# EasyEDA Pro project fei1554973967-sw3538-dff8db20.epro, board 显示核心板_1
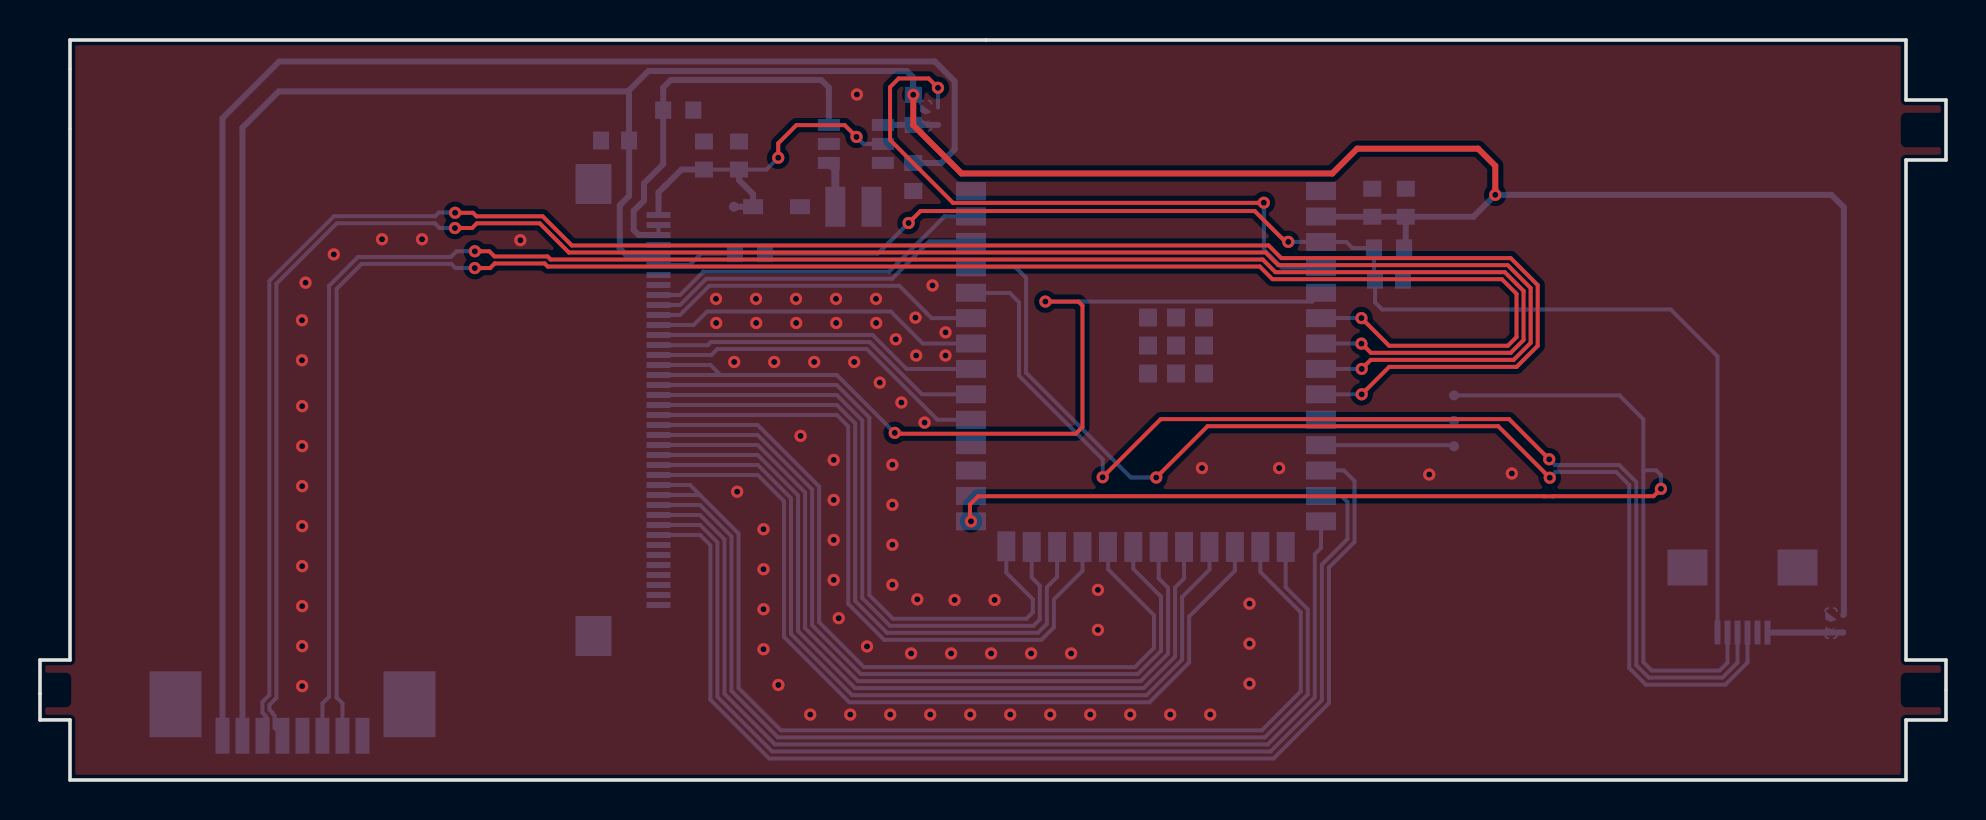
[diagram p5: board, top side]
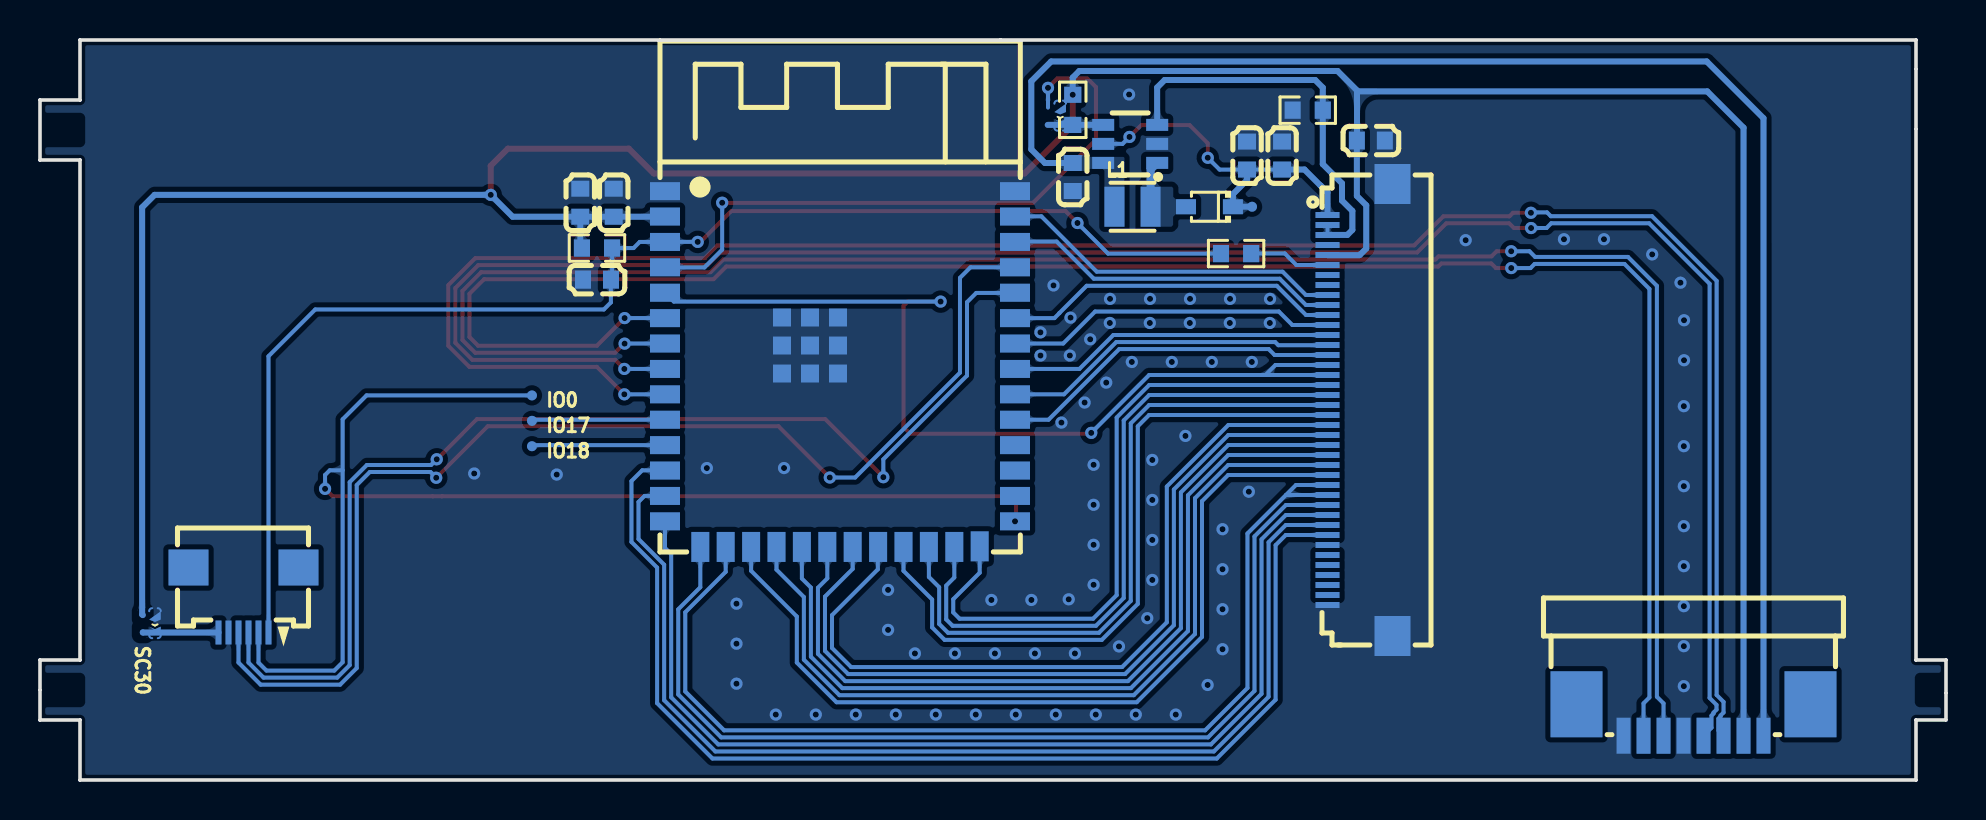
[diagram p6: board, bottom side, seen from below]

Outline 95.3 x 37 mm; copper layers: Top Layer, Bottom Layer. Coordinates in mm from the lower left corner of the outline.
Outline path: 0,6 1.5,6 1.5,37 93.3,37 93.3,34 95.3,34 95.3,31 93.3,31 93.3,6 95.3,6 95.3,3 93.3,3 93.3,0 1.5,0 1.5,3 0,3 0,6
Stack: Top Layer 0.035mm / Dielectric1 1.51mm FR4 er 4.5 / Bottom Layer 0.035mm

## Design rules (mm)
spacing copperThickness1oz (default): track to track 0.152, other pairs 0 to 0.175
spacing copperThickness2oz: track to track 0.203, other pairs 0.152 to 0.3
spacing Plane_innerPlane: track to track 0.152, other pairs 0 to 0.175
spacing Copper_copperRegion: track to track 0.152, other pairs 0 to 0.175
track width copperThickness1oz (default): min 0.127, default 0.254, max 2.54
track width copperThickness2oz: min 0.203, default 0.254, max 2.54
differential pair differentialPair (default): width min 0.127, default 0.254, max 2.54; gap min 0.152, default 0.152
pour e575 uses Copper_copperRegion
pour e586 uses Copper_copperRegion

## Placement (name value [footprint] x y rotation side)
C6  10uF  [C0603]  68.29 28.86 270 bottom
C7  100nF  [C0603]  66.61 28.86 270 bottom
C7#2  -  [C0603]  28.76 31.97 0 bottom
C12  1uF  [C0603]  67.45 25.02 180 bottom
C15  10uF  [C0603]  43.66 30.15 90 bottom
C16  10uF  [C0603]  33.2 31.22 270 bottom
C17  10uF  [C0603]  34.95 31.22 270 bottom
D2  1N5819WS  [SOD-323_L1.8-W1.3-LS2.5-RD]  36.83 28.66 0 bottom
FPC1  0.5-6PQFHY-H1.0 119  [FPC-SMD_6P-P0.50_SHOU-HAN_0.5-6PQFHY-H1.0]  85.12 9 0 bottom
FPC2  FPC-05FB-40PH20  [FPC-SMD_40P-P0.50_XUNPU_FPC-05FB-40PH20]  29.3 18.5 90 bottom
FPC4  AFA07-S08FCA-00  [FPC-SMD_8P-P1.00_LCS-XJ]  12.62 3 180 bottom
IO0  -  [Test-Point-0.5mm]  70.7 19.23 180 bottom
IO17  -  [Test-Point-0.5mm]  70.7 17.96 180 bottom
IO18  -  [Test-Point-0.5mm]  70.7 16.69 180 bottom
L1  10uH  [IND-SMD_L2.0-W2.0]  40.67 28.66 180 bottom
R7  10kΩ  [R0603]  67.45 26.6 0 bottom
R8  0R  [R0603]  35.5 26.32 0 bottom
R9  10Ω  [R0603]  31.91 33.49 0 bottom
R10  10kΩ  [R0603]  43.66 33.51 90 bottom
SC24  -  [短接点0402]  44.9 33.24 90 bottom
SC30  -  [短接点0402]  90.16 7.86 90 bottom
TP1  -  [Test-Point-0.5mm]  34.7 28.66 90 bottom
U1  ESP32-S3-WROOM-1-N16R8  [WIRELM-SMD_ESP32-S3-WROOM-1]  55.3 20.55 180 bottom
U5  SY7200AABC  [SOT-23-6_L2.9-W1.6-P0.95-LS2.8-BR]  40.79 31.81 180 bottom

## Footprints (pads in the part's own frame, mm; a bottom-side part is the same pattern mirrored in y, then rotated)
C0603
  rect 0.8x0.9 smd: 1(-0.7,0) 2(0.7,0)
FPC-SMD_6P-P0.50_SHOU-HAN_0.5-6PQFHY-H1.0
  rect 0.3x1.2 smd: 1(-1.25,1.625) 2(-0.75,1.625) 3(-0.25,1.625) 4(0.25,1.625) 5(0.75,1.625) 6(1.25,1.625)
  rect 2x1.8 smd: 7(2.75,-1.625) 8(-2.75,-1.625)
FPC-SMD_8P-P1.00_LCS-XJ
  rect 0.7x1.8 smd: 1(-3.498,-0.785) 2(-2.498,-0.785) 3(-1.498,-0.785) 4(-0.498,-0.785) 5(0.502,-0.785) 6(1.502,-0.785) 7(2.502,-0.785) 8(3.5,-0.784)
  rect 2.6x3.3 smd: 9(-5.85,0.785) 10(5.85,0.785)
FPC-SMD_40P-P0.50_XUNPU_FPC-05FB-40PH20
  rect 0.3x1.2 smd: 1(9.75,1.625) 2(9.25,1.625) 3(8.75,1.625) 4(8.25,1.625) 5(7.75,1.625) 6(7.25,1.625) 7(6.75,1.625) 8(6.25,1.625) 9(5.75,1.625) 10(5.25,1.625) 11(4.75,1.625) 12(4.25,1.625) 13(3.75,1.625) 14(3.25,1.625) 15(2.75,1.625) 16(2.25,1.625) 17(1.75,1.625) 18(1.25,1.625) 19(0.75,1.625) 20(0.25,1.625) 21(-0.25,1.625) 22(-0.75,1.625) 23(-1.25,1.625) 24(-1.75,1.625) 25(-2.25,1.625) 26(-2.75,1.625) 27(-3.25,1.625) 28(-3.75,1.625) 29(-4.25,1.625) 30(-4.75,1.625) 31(-5.25,1.625) 32(-5.75,1.625) 33(-6.25,1.625) 34(-6.75,1.625) 35(-7.25,1.625) 36(-7.75,1.625) 37(-8.25,1.625) 38(-8.75,1.625) 39(-9.25,1.625) 40(-9.75,1.625)
  rect 2x1.8 smd: 41(-11.3,-1.625) 42(11.3,-1.625)
IND-SMD_L2.0-W2.0
  rect 1x2 smd: 1(-0.905,0) 2(0.905,0)
R0603
  rect 0.806x0.864 smd: 1(-0.753,0) 2(0.753,0)
SOD-323_L1.8-W1.3-LS2.5-RD
  rect 1x0.75 smd: 1(-1.173,0) 2(1.173,0)
SOT-23-6_L2.9-W1.6-P0.95-LS2.8-BR
  rect 1.1x0.6 smd: 1(1.35,-0.95) 2(1.35,0) 3(1.35,0.95) 4(-1.35,0.95) 5(-1.35,0) 6(-1.35,-0.95)
Test-Point-0.5mm
  round 0.5 smd: 1(0,0)
WIRELM-SMD_ESP32-S3-WROOM-1
  rect 1.5x0.9 smd: 1(-8.75,8.895) 2(-8.75,7.625) 3(-8.75,6.355) 4(-8.75,5.085) 5(-8.75,3.815) 6(-8.75,2.545) 7(-8.75,1.275) 8(-8.75,0.005) 9(-8.75,-1.265) 10(-8.75,-2.535) 11(-8.75,-3.805) 12(-8.75,-5.075) 13(-8.75,-6.345) 14(-8.75,-7.615) 27(8.75,-7.615) 28(8.75,-6.345) 29(8.75,-5.075) 30(8.75,-3.805) 31(8.75,-2.535) 32(8.75,-1.265) 33(8.75,0.005) 34(8.75,1.275) 35(8.75,2.545) 36(8.75,3.815) 37(8.75,5.085) 38(8.75,6.355) 39(8.75,7.625) 40(8.75,8.895)
  rect 0.9x1.5 smd: 15(-6.985,-8.895) 16(-5.715,-8.895) 17(-4.445,-8.895) 18(-3.175,-8.895) 19(-1.905,-8.895) 20(-0.635,-8.895) 21(0.635,-8.895) 22(1.905,-8.895) 23(3.175,-8.895) 24(4.445,-8.895) 25(5.715,-8.895) 26(6.985,-8.865)
  rect 0.9x0.9 smd: 41(-2.9,-0.225) 41(-2.9,1.175) 41(-2.9,2.575) 41(-1.5,-0.225) 41(-1.5,1.175) 41(-1.5,2.575) 41(-0.1,-0.225) 41(-0.1,1.175) 41(-0.1,2.575)
短接点0402
  custom 0.579x0.58 smd: 1(-0.479,-0.61)
  custom 0.69x0.58 smd: 2(0.385,-0.61)

## Nets
As in the schematic, except:
3.3V: C6.2 C7.2 C7#2.2 FPC2.5 FPC4.7 R7.2 R10.2 SC30.2 U1.2
GND: C6.1 C7.1 C7#2.1 C12.1 C15.1 C16.1 C17.1 FPC1.5 FPC2.4 FPC2.34 FPC2.40 FPC2.41 FPC2.42 FPC4.1 FPC4.4 R9.2 U1.1 U1.40 U1.41 U5.2
GPIO0: FPC1.2 IO0.1 U1.27
GPIO17: IO17.1 U1.10
GPIO18: IO18.1 U1.11

Pads without a net: FPC1 7 8; FPC2 7 8 35 36 37 38 39; FPC4 9 10; U1 28 29 30

## Via types
v1: diameter 0.61, hole 0.305, Top Layer to Bottom Layer, 108 vias

## Routing (per net, layer and track width the routed paths; a pad name or vN(x,y) marks a point on that pad's centre or on a via; arc(x,y) is an arc through that point)
3.3V: length 159.1
  Top Layer w0.3: v1(72.76,29.26) 72.76,30.71 71.9,31.57 65.86,31.57 64.62,30.33 46.08,30.33 43.66,32.74 v1(43.66,34.26)
  Bottom Layer w0.3: 29.45,34.43 29.45,34.48 30.42,35.45 43.33,35.45 43.66,35.12 v1(43.66,34.26) ; 29.45,34.43 11.94,34.43 10.12,32.62 FPC4.7 ; 29.45,34.43 29.45,31.98 C7#2.2 29.46,29.2 28.99,28.73 28.99,26.57 29.32,26.25 30.92,26.25 FPC2.5 ; C6.2 68.29,26.68 R7.2 ; C6.2 71.67,28.16 v1(72.76,29.26) 89.57,29.26 90.19,28.63 90.19,8.28 90.16,8.25 ; C6.2 C7.2 64.06,28.16 U1.2
+5V: length 74.8
  Bottom Layer w0.3: FPC4.8 9.13,33.09 11.96,35.93 44.74,35.93 45.73,34.93 45.73,31.53 45.05,30.85 C15.2
GND:
  vias: v1(13.1,22.99) v1(13.1,20.99) v1(13.11,18.69) v1(13.11,16.69) v1(13.11,14.69) v1(13.11,12.69) v1(13.11,10.69) v1(13.11,8.69) v1(13.11,6.69) v1(13.11,4.69) v1(13.28,24.87) v1(14.69,26.28) v1(17.1,27.04) v1(19.1,27.04) v1(24.02,26.99) v1(33.8,24.06) v1(33.81,22.85) v1(34.71,20.9) v1(34.86,14.42) v1(35.8,24.06) v1(35.81,22.85) v1(36.17,12.54) v1(36.17,10.54) v1(36.17,8.54) v1(36.17,6.54) v1(36.71,20.9) v1(36.92,4.75) v1(37.8,24.06) v1(37.81,22.85) v1(38.03,17.2) v1(38.51,3.27) v1(38.71,20.9) v1(39.68,16) v1(39.68,14) v1(39.68,12) v1(39.68,10) v1(39.8,24.06) v1(39.81,22.85) v1(39.94,8.09) v1(40.51,3.27) v1(40.71,20.9) v1(40.85,34.27) v1(41.35,6.68) v1(41.8,24.06) v1(41.81,22.85) v1(41.99,19.87) v1(42.51,3.27) v1(42.62,15.76) v1(42.62,13.76) v1(42.62,11.76) v1(42.62,9.76) v1(42.79,22.03) v1(43.07,18.87) v1(43.55,6.33) v1(43.77,23.12) v1(43.81,21.22) v1(43.86,9.03) v1(44.23,17.87) v1(44.51,3.27) v1(44.62,24.73) v1(45.28,22.38) v1(45.27,21.22) v1(45.55,6.33) v1(45.73,9) v1(46.51,3.27) v1(47.55,6.33) v1(47.73,9) v1(48.51,3.27) v1(49.55,6.33) v1(50.51,3.27) v1(51.55,6.33) v1(52.51,3.27) v1(52.9,9.51) v1(52.9,7.51) v1(54.51,3.27) v1(56.51,3.27) v1(58.1,15.6) v1(58.51,3.27) v1(60.48,8.82) v1(60.48,6.82) v1(60.48,4.82) v1(61.96,15.6) v1(69.46,15.27) v1(73.59,15.33)
B0: length 47.8
  Top Layer w0.2: v1(50.27,23.92) 51.92,23.92 52.12,23.72 52.12,17.65 51.79,17.31 42.78,17.31 v1(42.74,17.36)
  Bottom Layer w0.2: FPC2.16 33.53,20.75 34.03,20.25 ; v1(50.27,23.92) 63.61,23.92 U1.5 ; v1(42.74,17.36) 39.84,20.25 34.03,20.25 ; 34.03,20.25 FPC2.17
B2: length 32.7
  Bottom Layer w0.2: U1.26 48.31,10.36 49.64,9.04 49.64,8.38 49.32,8.06 42.65,8.06 41.47,9.24 41.47,18.12 39.84,19.75 FPC2.18
B3: length 33
  Bottom Layer w0.2: FPC2.19 39.84,19.25 41.11,17.98 41.11,9.1 42.5,7.71 49.67,7.71 49.99,8.03 49.99,9.72 49.58,10.12 U1.25
B4: length 33.6
  Bottom Layer w0.2: FPC2.20 39.84,18.75 40.76,17.83 40.76,8.95 42.36,7.36 49.9,7.36 50.34,7.8 50.34,9.64 50.86,10.15 U1.24
B5: length 34.5
  Bottom Layer w0.2: U1.23 52.12,10.46 50.69,9.03 50.69,7.63 50.07,7.01 42.21,7.01 40.41,8.81 40.41,17.69 39.85,18.25 FPC2.21
CS: length 16.9
  Bottom Layer w0.2: U1.35 46.55,23.09 44.58,23.09 44.33,23.34 44.33,23.35 42.97,24.71 33.46,24.71 32,23.25 FPC2.11
DE: length 16.3
  Bottom Layer w0.2: FPC2.13 41.63,22.25 43.33,20.55 U1.33
EN: length 66.9
  Top Layer w0.2: v1(62.42,26.91) 62.28,26.91 60.73,28.45 44.03,28.45 v1(43.43,27.85)
  Bottom Layer w0.2: v1(62.42,26.91) 64.05,26.91 U1.3 65.31,26.9 65.62,26.6 66.7,26.6 ; FPC1.1 83.87,21.19 81.54,23.53 67.11,23.53 66.76,23.88 66.76,25.01 C12.2 66.7,25.07 R7.1 ; R8.2 41.9,26.32 v1(43.43,27.85)
FAN: length 104.3
  Top Layer w0.2: v1(20.75,28.36) 21.65,28.36 21.83,28.18 25.13,28.18 26.59,26.73 61.43,26.73 62.06,26.09 73.53,26.09 74.88,24.75 74.88,21.71 73.83,20.66 67.46,20.66 v1(66.08,19.28)
  Bottom Layer w0.2: U1.9 v1(66.08,19.28) ; 11.37,2.47 FPC4.6 ; v1(20.75,28.36) 20.74,28.38 19.95,28.38 19.76,28.19 14.7,28.19 11.47,24.96 11.47,4.25 11.12,3.91 11.12,3.37 11.27,3.22 11.27,3.17 11.37,3.07 11.37,2.47
G0: length 40.2
  Bottom Layer w0.2: U1.22 53.41,11.64 53.41,10.53 55.7,8.24 55.7,6.6 54.75,5.65 41.19,5.65 38.96,7.88 38.96,14.67 35.88,17.75 FPC2.22
G1: length 40.3
  Bottom Layer w0.2: U1.21 54.67,10.55 56.05,9.17 56.05,6.46 54.89,5.3 41.05,5.3 38.61,7.74 38.61,14.53 35.88,17.25 FPC2.23
G2: length 40.4
  Bottom Layer w0.2: FPC2.24 35.89,16.75 38.26,14.38 38.26,7.59 40.9,4.94 55.04,4.94 56.4,6.31 56.4,9.61 55.93,10.08 U1.20
G3: length 41
  Bottom Layer w0.2: U1.19 57.2,10.07 56.76,9.62 56.76,6.16 55.18,4.59 40.76,4.59 37.9,7.45 37.9,14.23 35.89,16.25 FPC2.25
G4: length 41.9
  Bottom Layer w0.2: FPC2.26 35.89,15.75 37.55,14.09 37.55,7.3 40.61,4.24 55.33,4.24 57.11,6.02 57.11,9.15 58.48,10.52 U1.18
G5: length 42.8
  Bottom Layer w0.2: U1.17 59.74,10.46 57.46,8.17 57.46,5.87 55.48,3.89 40.46,3.89 37.2,7.15 37.2,13.94 35.89,15.25 FPC2.27
GPIO0: length 65.6
  Top Layer w0.2: v1(46.55,12.93) 46.5,12.98 46.5,13.77 46.92,14.19 75.2,14.19 75.21,14.19 75.67,14.19 75.67,14.19 80.68,14.19 v1(81.05,14.56)
  Bottom Layer w0.2: 80.17,15.49 80.17,5.89 80.58,5.47 83.98,5.47 84.37,5.87 FPC1.2 ; 80.17,15.49 80.81,15.49 81.05,15.25 v1(81.05,14.56) ; 80.17,15.49 80.17,18.03 78.97,19.23 IO0.1
GPIO1: length 17.3
  Bottom Layer w0.2: FPC2.9 32,24.25 33.17,25.42 42.46,25.42 45.23,28.18 46.54,28.18 U1.39
GPIO2: length 16.9
  Bottom Layer w0.2: U1.38 46.53,26.92 44.47,26.92 42.61,25.06 33.31,25.06 32,23.75 FPC2.10
GPIO3: length 50.5
  Bottom Layer w0.2: FPC2.30 33,13.75 34.58,12.18 34.58,4.45 36.9,2.13 61.24,2.13 63.39,4.28 63.39,8.53 62.29,9.64 U1.15
GPIO4: length 32
  Top Layer w0.2: v1(61.19,28.86) 61.19,28.86 45.65,28.86 42.5,32 42.5,34.65 42.93,35.08 44.43,35.08 v1(44.9,34.61)
  Bottom Layer w0.2: v1(61.19,28.86) 61.19,26.51 62.08,25.63 64.05,25.63 U1.4 ; 44.9,33.62 v1(44.9,34.61)
GPIO6: length 95.5
  Top Layer w0.2: v1(21.74,25.6) 22.5,25.6 22.73,25.83 25.23,25.83 25.38,25.67 60.99,25.67 61.62,25.04 73.1,25.04 73.83,24.31 73.83,22.15 73.39,21.71 67.45,21.71 v1(66.07,23.1)
  Bottom Layer w0.2: v1(66.07,23.1) 64.05,23.1 U1.6 ; v1(21.74,25.6) 20.77,25.6 20.57,25.8 16.08,25.8 14.83,24.55 14.83,4.13 15.12,3.83 FPC4.2
GPIO7: length 96.9
  Top Layer w0.2: v1(21.74,26.44) 22.47,26.44 22.72,26.18 25.37,26.18 25.53,26.02 61.14,26.02 61.77,25.39 73.24,25.39 74.18,24.45 74.18,22 73.54,21.36 66.54,21.36 66.08,21.82
  Bottom Layer w0.2: FPC4.3 14.12,3.83 14.45,4.16 14.45,24.71 15.9,26.15 20.54,26.15 20.83,26.44 v1(21.74,26.44) ; U1.7 66.08,21.82 66.08,21.82
  vias: v1(66.07,21.82)
GPIO8: length 57.4
  Bottom Layer w0.2: FPC2.33 33.01,12.25 33.52,11.74 33.52,4.02 36.46,1.07 61.68,1.07 64.44,3.84 64.44,10.62 65.73,11.9 65.73,14.94 65.19,15.48 64.06,15.48 U1.12
GPIO15: length 102.3
  Top Layer w0.2: v1(20.75,27.6) 21.6,27.6 21.84,27.83 24.99,27.83 26.44,26.38 61.28,26.38 61.91,25.74 73.39,25.74 74.53,24.6 74.53,21.86 73.68,21.01 66.54,21.01 v1(66.08,20.55)
  Bottom Layer w0.2: FPC4.5 11.72,2.61 11.72,3.22 11.62,3.32 11.62,3.37 11.47,3.52 11.47,3.76 11.82,4.1 11.82,24.81 14.84,27.84 19.74,27.84 19.98,27.6 v1(20.75,27.6) ; U1.8 v1(66.08,20.55)
GPIO17: length 6.7
  Bottom Layer w0.2: U1.10 70.65,18.01 IO17.1
GPIO18: length 6.7
  Bottom Layer w0.2: U1.11 70.65,16.74 IO18.1
GPIO19: length 55.3
  Bottom Layer w0.2: U1.13 65.07,14.2 65.37,13.9 65.37,12.05 64.09,10.77 64.09,3.99 61.53,1.43 36.61,1.43 33.87,4.16 33.87,11.89 33.01,12.75 FPC2.32
GPIO20: length 52
  Bottom Layer w0.2: FPC2.31 33.01,13.25 34.22,12.03 34.22,4.31 36.75,1.78 61.38,1.78 63.74,4.13 63.74,11.29 64.05,11.6 ; 64.05,11.6 U1.14
GPIO38: length 17.2
  Bottom Layer w0.2: U1.31 44.87,18.01 41.34,21.55 33.87,21.55 33.57,21.25 FPC2.15
GPIO39: length 16.8
  Bottom Layer w0.2: FPC2.14 30.94,21.74 33.38,21.74 33.54,21.9 41.49,21.9 44.1,19.28 U1.32
GPIO41: length 16.6
  Bottom Layer w0.2: U1.34 46.55,21.83 44.14,21.83 42.54,23.42 33.36,23.42 32.68,22.75 FPC2.12
GPIO46: length 52.7
  Bottom Layer w0.2: 33,14.25 32.5,14.75 FPC2.28 ; 33,14.25 FPC2.29 ; 33,14.25 34.93,12.32 34.93,4.6 37.04,2.48 61.09,2.48 63.04,4.43 63.04,8.39 61.02,10.41 U1.16
LEDA: length 17.7
  Top Layer w0.2: v1(36.91,31.11) 36.91,31.84 37.82,32.75 40.23,32.75 v1(40.83,32.15)
  Bottom Layer w0.2: C16.2 C17.2 36.32,30.52 v1(36.91,31.11) ; v1(40.83,32.15) 41.17,31.81 U5.5
  Bottom Layer w0.3: C16.2 33.19,30.52 32.08,30.52 31.28,29.72 31.27,29.72 30.92,29.38 FPC2.1 ; C17.2 34.95,30 35.65,29.29 D2.1 TP1.1
LEDK: length 20
  Bottom Layer w0.2: FPC2.3 FPC2.2
  Bottom Layer w0.3: FPC2.3 30.92,27.25 29.93,27.25 29.68,27.5 29.68,28.45 30.2,28.97 30.2,29.83 31.16,30.79 R9.1 31.16,34.62 31.54,35 39.07,35 39.44,34.62 39.44,32.76
RESET: length 4.1
  Bottom Layer w0.2: R8.1 34.74,26.33 33.06,26.33 32.48,25.75 FPC2.6
RX: length 58.6
  Top Layer w0.2: v1(53.13,15.14) 56.04,18.04 73.45,18.04 v1(75.46,16.04)
  Bottom Layer w0.2: U1.36 46.56,24.35 48.49,24.35 48.95,23.89 48.95,20.22 53.13,16.03 v1(53.13,15.14) ; v1(75.46,16.04) 75.75,15.75 78.96,15.75 79.82,14.89 79.82,5.74 80.44,5.12 84.12,5.12 84.87,5.87 FPC1.3
TX: length 59.9
  Top Layer w0.2: v1(55.81,15.12) 58.38,17.69 72.91,17.69 v1(75.49,15.11)
  Bottom Layer w0.2: v1(75.49,15.11) 75.78,15.4 78.81,15.4 79.46,14.75 79.46,5.6 80.29,4.77 84.27,4.77 85.37,5.87 FPC1.4 ; U1.37 48.78,25.63 49.3,25.11 49.3,20.36 54.54,15.12 v1(55.81,15.12)
$1N2484: length 2.3
  Bottom Layer w0.4: L1.2 39.77,30.53 U5.1
$1N2494: length 2.8
  Bottom Layer w0.3: U5.4 R10.1 44.91,32.75
$1N4031: length 3.8
  Bottom Layer w0.3: FPC1.6 90.15,7.38 90.16,7.38

## Copper pours and planes (outline as drawn; the poured copper is in the pictures)
+5V on Bottom Layer: 41.08,31.25 44.11,31.25 44.11,27.66 41.08,27.66
GND on Top Layer: -6.19,46.18 104.54,46.18 104.54,-13.91 -6.19,-13.91
GND on Bottom Layer: -6.22,45.33 98.88,45.33 98.88,-5.53 -6.22,-5.53
$1N2484 on Bottom Layer: 37.5,29.66 40.27,29.66 40.27,27.66 37.5,27.66

Small or netless copper shapes (teardrops, artwork), in the pictures only: 24 on Top Layer, 142 on Bottom Layer
